# Altium schematic sheet starfish_5.SchDoc: starfish
size 282 x 208 mm; Origin: Eagle; Date: 4/18/2022 11:53:22 PM; SheetNumber: 6; GateName_1: G$1; SymbolName_1: A4L-LOC; LibraryName: frames; DeviceSetName: A4L-LOC; Sheet: Sheet:
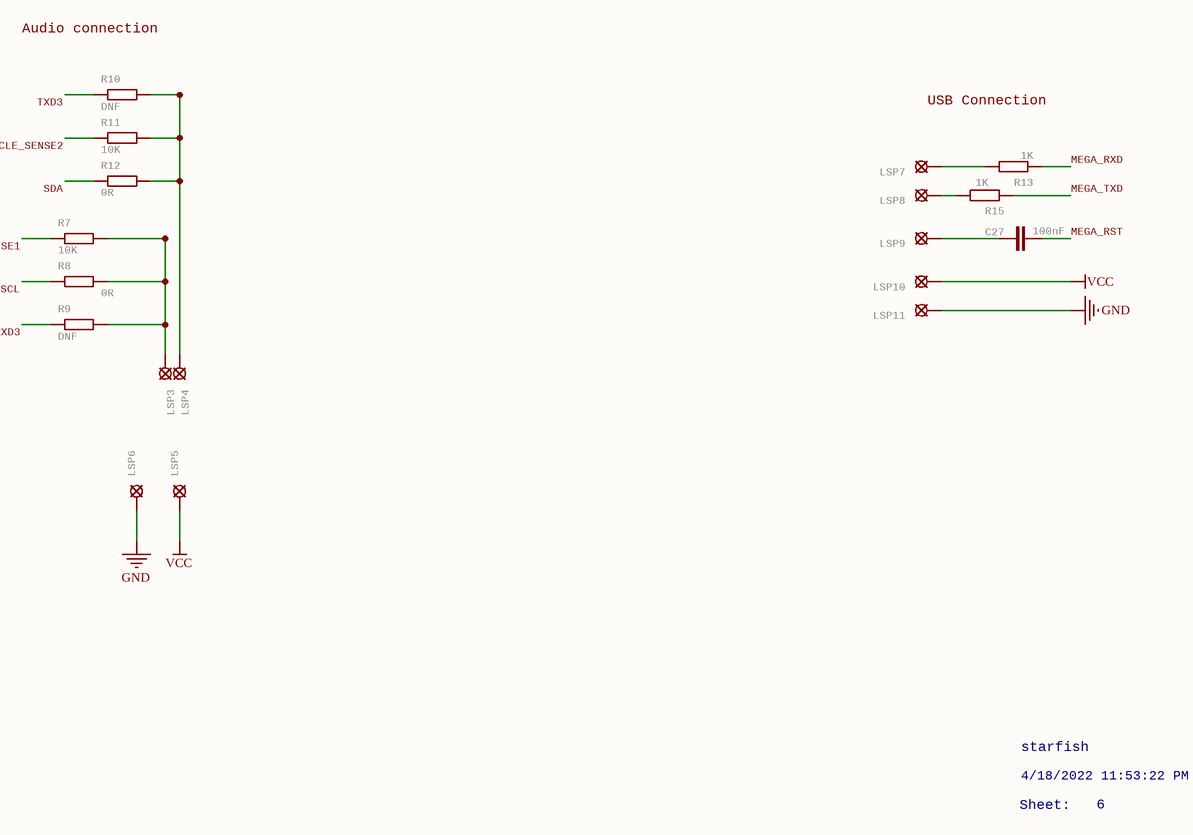
[diagram p0: starfish_5.SchDoc]

## Parts
C27  100nF  [C0603]
LSP3  LSP10  [LSP10]  (value not drawn)
LSP4  LSP10  [LSP10]  (value not drawn)
LSP5  LSP10  [LSP10]  (value not drawn)
LSP6  LSP10  [LSP10]  (value not drawn)
LSP7  LSP10  [LSP10]  (value not drawn)
LSP8  LSP10  [LSP10]  (value not drawn)
LSP9  LSP10  [LSP10]  (value not drawn)
LSP10  LSP10  [LSP10]  (value not drawn)
LSP11  LSP10  [LSP10]  (value not drawn)
R7  10K  [R0603]
R8  0R  [R0603]
R9  DNF  [R0603]
R10  DNF  [R0603]
R11  10K  [R0603]
R12  0R  [R0603]
R13  1K  [R0603]
R15  1K  [R0603]

## Nets
GND: LSP6.MP LSP11.MP
VCC: LSP5.MP LSP10.MP
MEGA_RST: C27.2
MEGA_RXD: R13.1
MEGA_TXD: R15.1
MUSCLE_SENSE1: R7.1
MUSCLE_SENSE2: R11.1
RXD3: R9.1
SCL: R8.1
SDA: R12.1
TXD3: R10.1
NetC27_1: C27.1 LSP9.MP
NetLSP3_MP: LSP3.MP R7.2 R8.2 R9.2
NetLSP4_MP: LSP4.MP R10.2 R11.2 R12.2
NetLSP7_MP: LSP7.MP R13.2
NetLSP8_MP: LSP8.MP R15.2

## Notes on the sheet
- Audio connection
- USB Connection
- starfish
- Sheet:
- 4/18/2022 11:53:22 PM
- 6

## Library data of the parts
C27 = C-EUC0603: CAPACITOR, European symbol; GateName_1: G$1; SymbolName_1: C-EU; DeviceName: C0603; LibraryName: resistor; DeviceSetName: C-EU
LSP3-LSP11 = LSP10: SOLDER PAD    drill 1.0 mm, distributor Buerklin, 12H555; GateName_1: 1; SymbolName_1: LSP; POPULARITY: 52; LibraryName: solpad; DeviceSetName: LSP10
R7-R13 R15 = R-EU_R0603: RESISTOR, European symbol; GateName_1: G$1; SymbolName_1: R-EU; DeviceSetName: R-EU_; DeviceName: R0603; LibraryName: resistor